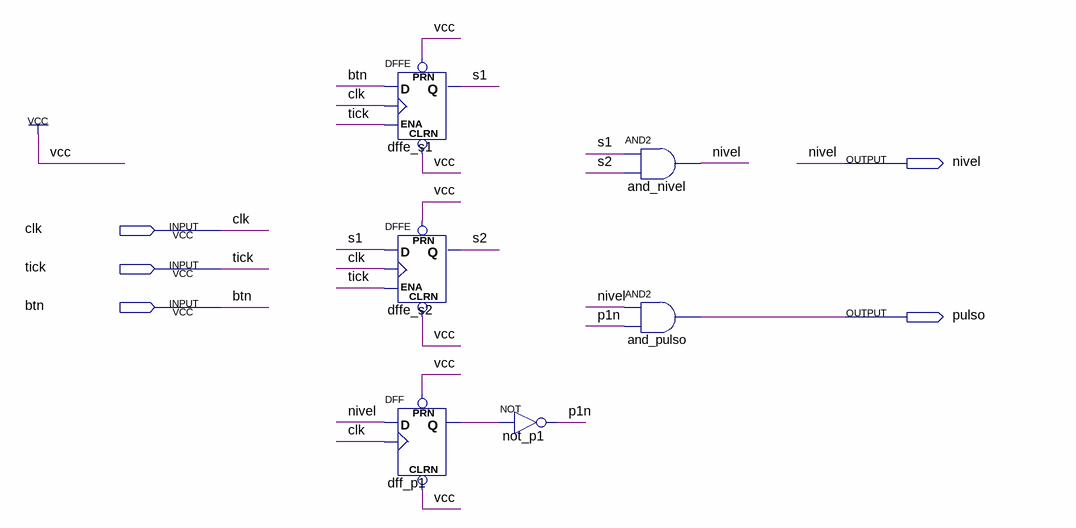
[diagram p0: schematic sheet]
// Quartus schematic botao.bdf as structural Verilog: 6 symbols, 5 pins
module botao (
  input  clk,
  input  tick,
  input  btn,
  output nivel,
  output pulso
);

  wire dff_p1_q, p1n, s1, s2;

  DFFE dffe_s1 (.PRN(1'b1), .CLRN(1'b1), .D(btn), .CLK(clk), .ENA(tick), .Q(s1));
  DFFE dffe_s2 (.PRN(1'b1), .CLRN(1'b1), .D(s1), .CLK(clk), .ENA(tick), .Q(s2));
  DFF dff_p1 (.CLRN(1'b1), .CLK(clk), .D(nivel), .PRN(1'b1), .Q(dff_p1_q));
  not not_p1 (p1n, dff_p1_q);
  and and_nivel (nivel, s1, s2);
  and and_pulso (pulso, nivel, p1n);
endmodule
